# Altium schematic sheet GPIOs_Expander_Relay_Sheet.SchDoc
size 420 x 297 mm; SheetNumber: 5; SheetTotal: 12
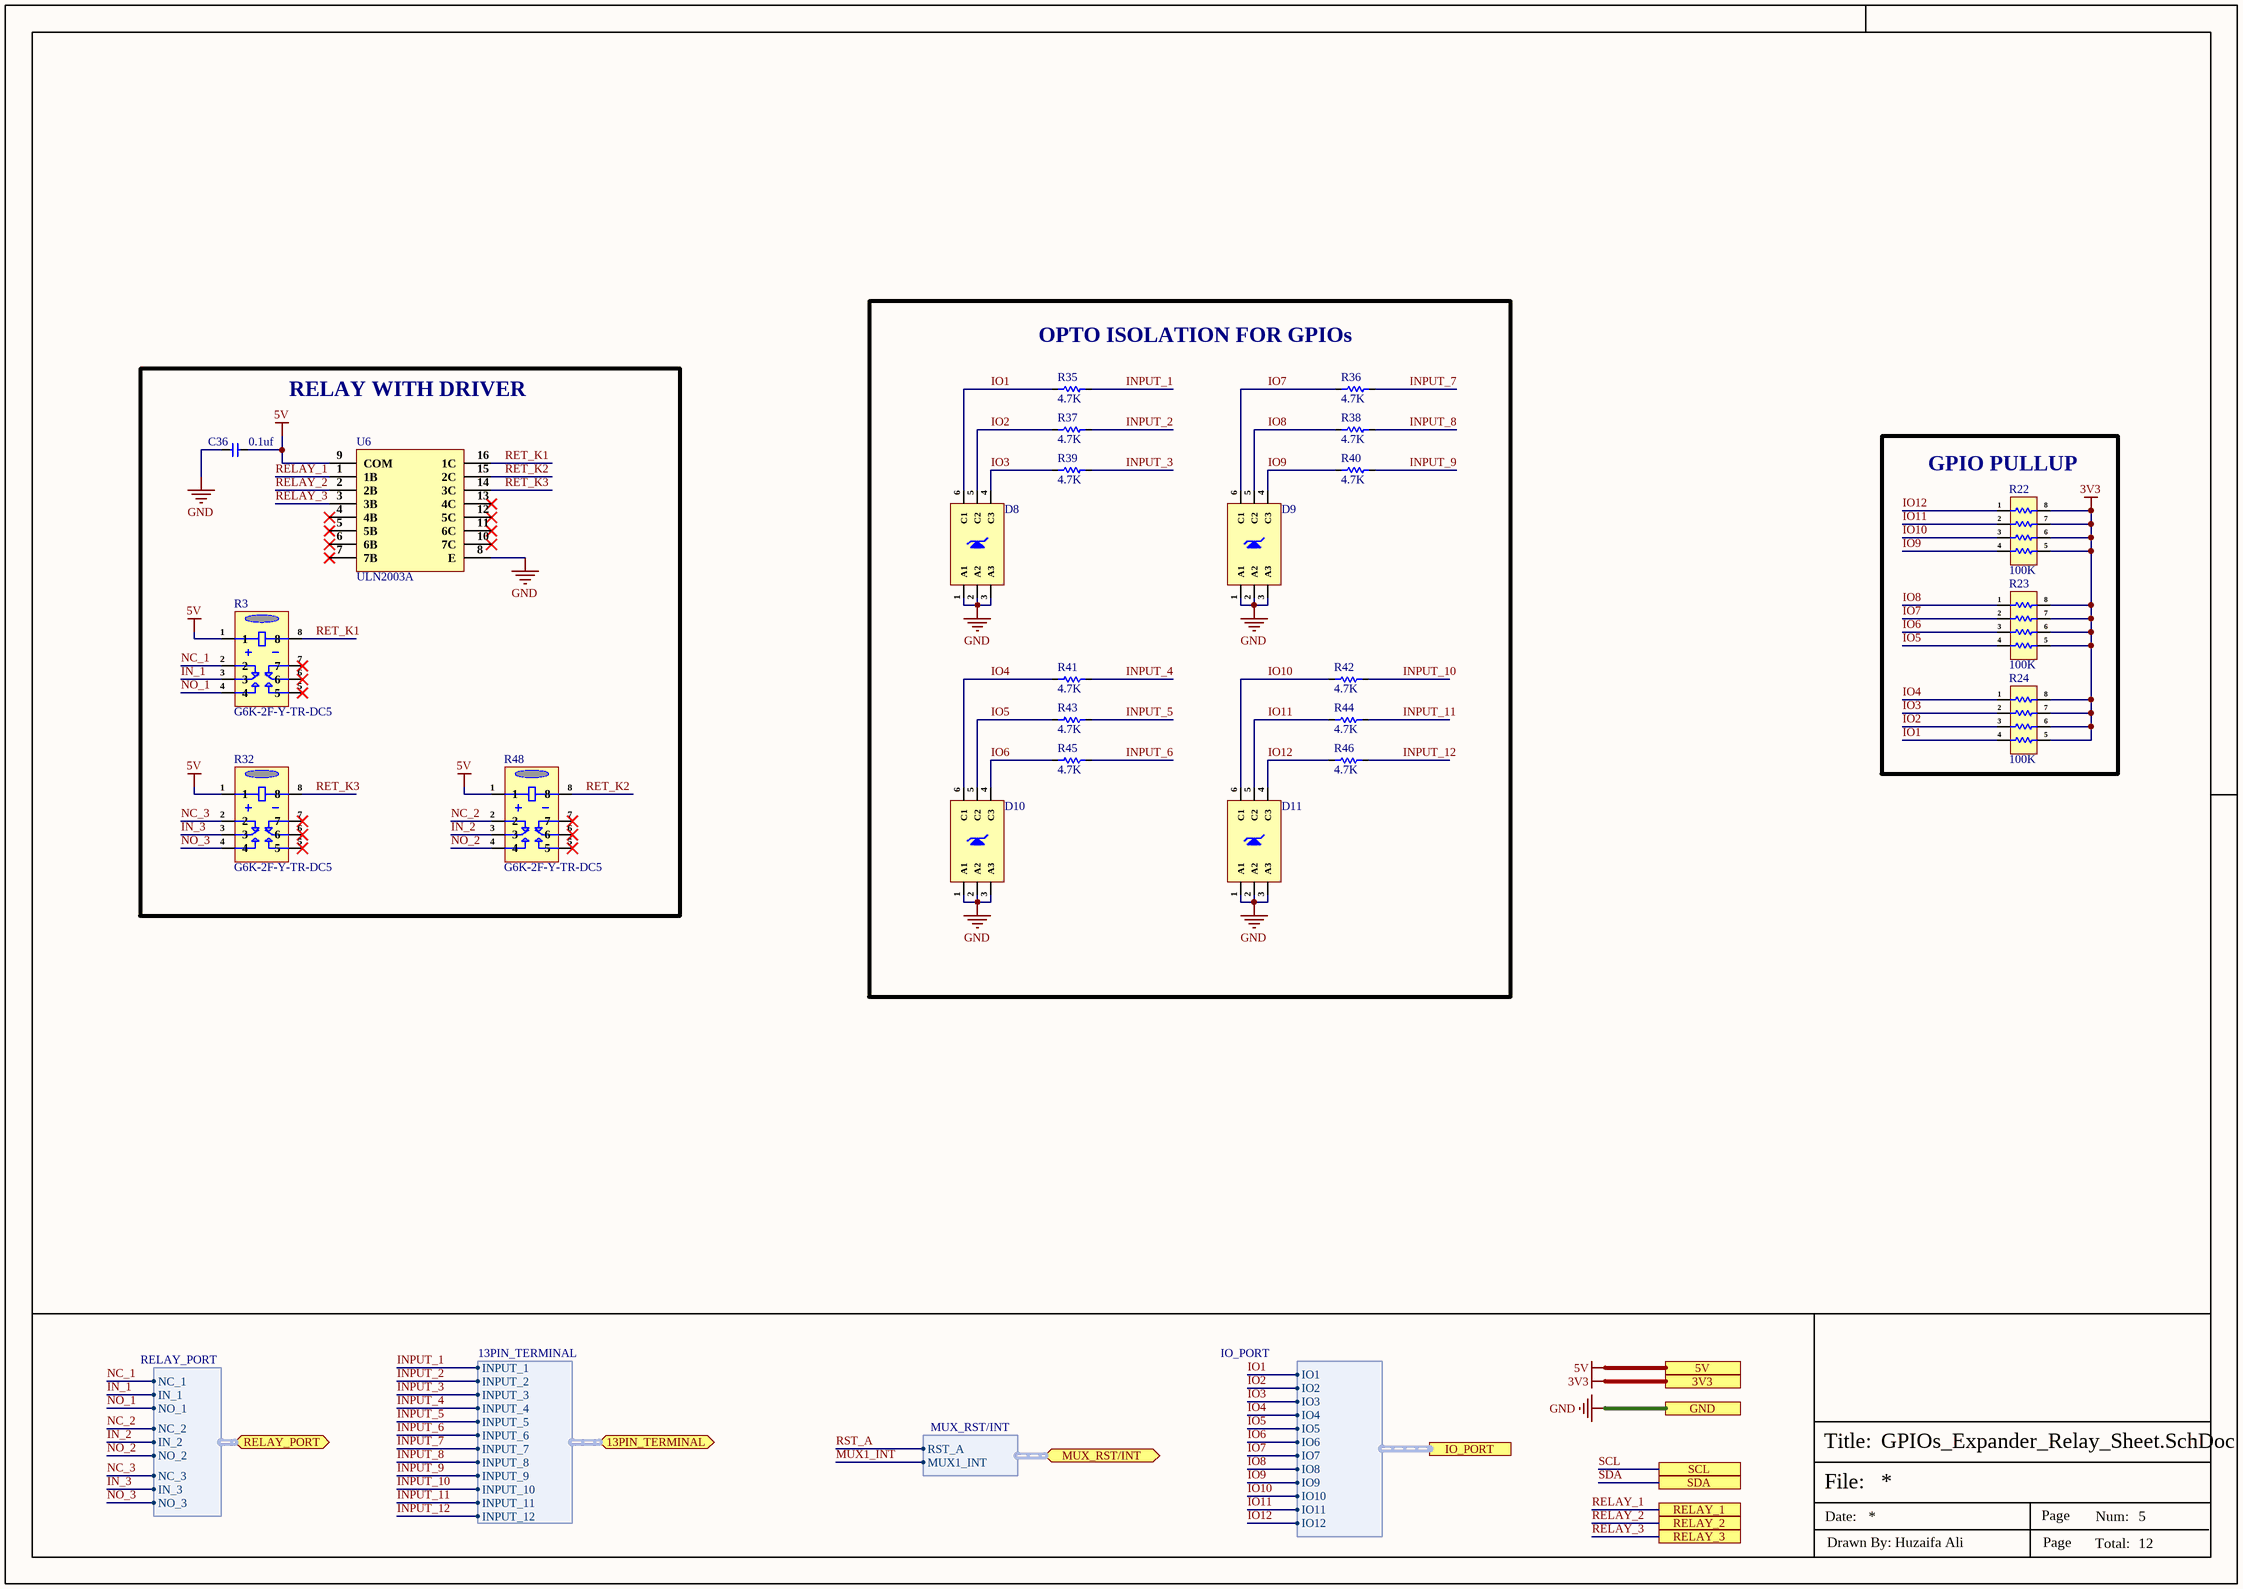
[diagram p0: GPIOs_Expander_Relay_Sheet.SchDoc]

## Parts
C36  0.1uf  [Cap-0402]
D8  BZX84C3V3TS-7-F  [SOT-363]  (value not drawn)
D9  BZX84C3V3TS-7-F  [SOT-363]  (value not drawn)
D10  BZX84C3V3TS-7-F  [SOT-363]  (value not drawn)
D11  BZX84C3V3TS-7-F  [SOT-363]  (value not drawn)
R3  G6K-2F-Y-TR-DC5  [G6K-2F-Y-TR DC5]
R22  100K  [YC164-JR-070RL]
R23  100K  [YC164-JR-070RL]
R24  100K  [YC164-JR-070RL]
R32  G6K-2F-Y-TR-DC5  [G6K-2F-Y-TR DC5]
R35  4.7K  [Res-0402]
R36  4.7K  [Res-0402]
R37  4.7K  [Res-0402]
R38  4.7K  [Res-0402]
R39  4.7K  [Res-0402]
R40  4.7K  [Res-0402]
R41  4.7K  [Res-0402]
R42  4.7K  [Res-0402]
R43  4.7K  [Res-0402]
R44  4.7K  [Res-0402]
R45  4.7K  [Res-0402]
R46  4.7K  [Res-0402]
R48  G6K-2F-Y-TR-DC5  [G6K-2F-Y-TR DC5]
U6  ULN2003A  [SOP-16_150mil]

## Blocks framed on the sheet
OPTO ISOLATION FOR GPIOs: D8-D11 R35-R46
RELAY WITH DRIVER: C36 R3 R32 R48 U6
GPIO PULLUP: R22-R24

## Ports
3V3, 5V, 13PIN_TERMINAL (bidir, harness 13PIN_TERMINAL), GND, IO_PORT (harness IO_PORT), MUX_RST/INT (bidir, harness MUX_RST/INT), RELAY_1, RELAY_2, RELAY_3, RELAY_PORT (bidir, harness RELAY_PORT), SCL, SDA

## Harnesses
RELAY_PORT: NC_1, NC_2, IN_1, IN_2, NO_1, NO_2, NC_3, IN_3, NO_3
13PIN_TERMINAL: INPUT_7, INPUT_1, INPUT_2, INPUT_8, INPUT_3, INPUT_9, INPUT_4, INPUT_10, INPUT_5, INPUT_11, INPUT_6, INPUT_12
MUX_RST/INT: RST_A, MUX1_INT
IO_PORT: IO1, IO2, IO3, IO4, IO5, IO6, IO7, IO9, IO10, IO11, IO12, IO8

## Nets
3V3: R22.5 R22.6 R22.7 R22.8 R23.5 R23.6 R23.7 R23.8 R24.5 R24.6 R24.7 R24.8 ; port 3V3
5V: C36.1 R3.1 R32.1 R48.1 U6.9(COM) ; port 5V
GND: C36.2 D8.1(A1) D8.2(A2) D8.3(A3) D9.1(A1) D9.2(A2) D9.3(A3) D10.1(A1) D10.2(A2) D10.3(A3) D11.1(A1) D11.2(A2) D11.3(A3) U6.8(E) ; port GND
IN_1: R3.3 ; port RELAY_PORT.IN_1
IN_2: R48.3 ; port RELAY_PORT.IN_2
IN_3: R32.3 ; port RELAY_PORT.IN_3
INPUT_1: R35.2 ; port 13PIN_TERMINAL.INPUT_1
INPUT_2: R37.2 ; port 13PIN_TERMINAL.INPUT_2
INPUT_3: R39.2 ; port 13PIN_TERMINAL.INPUT_3
INPUT_4: R41.2 ; port 13PIN_TERMINAL.INPUT_4
INPUT_5: R43.2 ; port 13PIN_TERMINAL.INPUT_5
INPUT_6: R45.2 ; port 13PIN_TERMINAL.INPUT_6
INPUT_7: R36.2 ; port 13PIN_TERMINAL.INPUT_7
INPUT_8: R38.2 ; port 13PIN_TERMINAL.INPUT_8
INPUT_9: R40.2 ; port 13PIN_TERMINAL.INPUT_9
INPUT_10: R42.2 ; port 13PIN_TERMINAL.INPUT_10
INPUT_11: R44.2 ; port 13PIN_TERMINAL.INPUT_11
INPUT_12: R46.2 ; port 13PIN_TERMINAL.INPUT_12
IO1: D8.6(C1) R24.4 R35.1 ; port IO_PORT.IO1
IO2: D8.5(C2) R24.3 R37.1 ; port IO_PORT.IO2
IO3: D8.4(C3) R24.2 R39.1 ; port IO_PORT.IO3
IO4: D10.6(C1) R24.1 R41.1 ; port IO_PORT.IO4
IO5: D10.5(C2) R23.4 R43.1 ; port IO_PORT.IO5
IO6: D10.4(C3) R23.3 R45.1 ; port IO_PORT.IO6
IO7: D9.6(C1) R23.2 R36.1 ; port IO_PORT.IO7
IO8: D9.5(C2) R23.1 R38.1 ; port IO_PORT.IO8
IO9: D9.4(C3) R22.4 R40.1 ; port IO_PORT.IO9
IO10: D11.6(C1) R22.3 R42.1 ; port IO_PORT.IO10
IO11: D11.5(C2) R22.2 R44.1 ; port IO_PORT.IO11
IO12: D11.4(C3) R22.1 R46.1 ; port IO_PORT.IO12
MUX1_INT: port MUX_RST/INT.MUX1_INT
NC_1: R3.2 ; port RELAY_PORT.NC_1
NC_2: R48.2 ; port RELAY_PORT.NC_2
NC_3: R32.2 ; port RELAY_PORT.NC_3
NO_1: R3.4 ; port RELAY_PORT.NO_1
NO_2: R48.4 ; port RELAY_PORT.NO_2
NO_3: R32.4 ; port RELAY_PORT.NO_3
RELAY_1: U6.1(1B) ; port RELAY_1
RELAY_2: U6.2(2B) ; port RELAY_2
RELAY_3: U6.3(3B) ; port RELAY_3
RET_K1: R3.8 U6.16(1C)
RET_K2: R48.8 U6.15(2C)
RET_K3: R32.8 U6.14(3C)
RST_A: port MUX_RST/INT.RST_A
SCL: port SCL
SDA: port SDA

Not connected (* = marked no-connect by the designer): R3 5* 6* 7*; R32 5* 6* 7*; R48 5* 6* 7*; U6 4(4B)* 5(5B)* 6(6B)* 7(7B)* 10(7C)* 11(6C)* 12(5C)* 13(4C)*

## Notes on the sheet
- File:
- Title:
- Date:
- Page
- Num:
- Total:
- Drawn By: Huzaifa Ali

## Library data of the parts
C36 = GRM155R62A104KE14D: CAP CER 0.1UF 100V X5R 0402; Manufacturer: Murata; Capacitance: 100nF; Tolerance: 10%; Item Type: Capacitor; Supplier 1: Arrow Electronics; Manufacturer Part Number: GRM155R62A104KE14D; RoHS: Yes; Category: Ceramic Capacitors; Stock 1: 870000; Pricing 1: 10000=0.00500, 20000=0.00410, 30000=0.00390, 50000=0.00370, 100000=0.00300 (USD); Mount: Surface Mount; Case/Package: 0402; Case Code (Metric): 1005; Case Code (Imperial): 0402; Weight: 0.000212oz; Min Operating Temperature: -55°C; Max Operating Temperature: 85°C; Packaging: Tape and Reel; Voltage Rating: 100V; Dielectric: X5R; Termination: SMD/SMT; Voltage Rating (DC): 100V; Package Quantity: 10000; Series: GRM; Length: 0.039inch; Width: 0.02inch; Height: 0.5mm; Thickness: 0.022inch; Reach SVHC Compliant: Yes; Lead Free: Lead Free; RoHS Compliant: Yes; ComponentLink1URL: http://www.farnell.com/datasheets/2079151.pdf?src-supplier=Farnell; ComponentLink1Description: http://www.farnell.com/datasheets/2079151.pdf?src-supplier=Farnell; ComponentLink2URL: http://www.mouser.com/ds/2/281/c02e-2905.pdf?src-supplier=Mouser; ComponentLink2Description: http://www.mouser.com/ds/2/281/c02e-2905.pdf?src-supplier=Mouser; ComponentLink3URL: http://www.farnell.com/datasheets/2079151.pdf?src-supplier=Element14; ComponentLink3Description: http://www.farnell.com/datasheets/2079151.pdf?src-supplier=Element14; ComponentLink4URL: http://search.murata.co.jp/Ceramy/image/img/A01X/G101/ENG/GRM155R62A104KE14-01.pdf?src-supplier=Digi-Key; ComponentLink4Description: http://search.murata.co.jp/Ceramy/image/img/A01X/G101/ENG/GRM155R62A104KE14-01.pdf?src-supplier=Digi-Key; ComponentLink5URL: http://www.farnell.com/datasheets/2079151.pdf?src-supplier=Newark; ComponentLink5Description: http://www.farnell.com/datasheets/2079151.pdf?src-supplier=Newark; Supplier Part Number 1: GRM155R62A104KE14D; LCSC Part Number: C162178
D8-D11 = BZX84C3V3TS-7-F: DIODE ZENER ARRAY 3.3V SOT363; Manufacturer: Diodes Incorporated; Manufacturer Part Number: BZX84C3V3TS-7-F; Package: SOT-363-6; LCSC Part Number: C5124989; Item Type: Diode; ComponentLink1Description: LCSC; ComponentLink1URL: https://www.lcsc.com/product-detail/Zener-Diodes_Diodes-Incorporated-BZX84C3V3TS-7-F_C5124989.html
R3 R32 R48 = G6K-2F-Y-TR-DC5: RELAY TELECOM DPDT 1A 5V; Manufacturer: Omron; Supplier: Digikey; Supplier Part Number: Z128CT-ND; Manufacturer Part Number: G6K-2F-Y-TR-DC5; RoHS: Yes; Category: Signal Relays; Stock: 17486; Pricing: 1=4.49, 10=4.211, 25=3.7428, 50=3.5558, 100=3.3686, 250=2.99428 (USD); ComponentLink1URL: https://datasheet.ciiva.com/2416/en-g6k-2416490.pdf?src-supplier=Digikey; ComponentLink1Description: https://datasheet.ciiva.com/2416/en-g6k-2416490.pdf?src-supplier=Digikey; ComponentLink2URL: https://datasheet.ciiva.com/30094/81en-g6k-30094551.pdf?src-supplier=Onlinecomponents.com; ComponentLink2Description: https://datasheet.ciiva.com/30094/81en-g6k-30094551.pdf?src-supplier=Onlinecomponents.com; LCSC Part Number: C47190; Item Type: Relay
R22-R24 = YC164-JR-07100KL: RES ARRAY 4 RES 100K OHM 1206; Manufacturer: Yageo; Item Type: Resistor; Supplier: Future Electronics; Supplier Part Number: 4734737; Manufacturer Part Number: YC164-JR-07100KL; RoHS: Yes; Category: Resistor Arrays; Stock: 10000; Pricing: 5000=0.0086, 20000=0.0082, 50000=0.0078, 100000=0.0078, 125000=0.0075, 200000=0.0076, 625000=0.0071 (USD); ComponentLink1URL: https://datasheet.ciiva.com/11807/0900766b80c69e1d-11807026.pdf?src-supplier=Rs; ComponentLink1Description: https://datasheet.ciiva.com/11807/0900766b80c69e1d-11807026.pdf?src-supplier=Rs; ComponentLink2URL: https://datasheet.ciiva.com/8017/443424-8017993.pdf?src-supplier=Element14; ComponentLink2Description: https://datasheet.ciiva.com/8017/443424-8017993.pdf?src-supplier=Element14; ComponentLink3URL: https://datasheet.ciiva.com/8017/443424-8017994.pdf?src-supplier=Element14; ComponentLink3Description: https://datasheet.ciiva.com/8017/443424-8017994.pdf?src-supplier=Element14; ComponentLink4URL: https://datasheet.ciiva.com/17478/pyu-yc-tc164-51-rohs-l-3-17478885.pdf?src-supplier=Future+Electronics; ComponentLink4Description: https://datasheet.ciiva.com/17478/pyu-yc-tc164-51-rohs-l-3-17478885.pdf?src-supplier=Future+Electronics; ComponentLink5URL: https://datasheet.ciiva.com/2693/pyu-yc-tc164-51-rohs-l-3-2693249.pdf?src-supplier=Digi-Key; ComponentLink5Description: https://datasheet.ciiva.com/2693/pyu-yc-tc164-51-rohs-l-3-2693249.pdf?src-supplier=Digi-Key; ComponentLink6URL: https://datasheet.ciiva.com/2693/pyu-yc-tc164-51-rohs-l-3-2693250.pdf?src-supplier=Digi-Key; ComponentLink6Description: https://datasheet.ciiva.com/2693/pyu-yc-tc164-51-rohs-l-3-2693250.pdf?src-supplier=Digi-Key; ComponentLink7URL: https://datasheet.ciiva.com/2693/pyu-yc-tc164-51-rohs-l-3-2693251.pdf?src-supplier=Digi-Key; ComponentLink7Description: https://datasheet.ciiva.com/2693/pyu-yc-tc164-51-rohs-l-3-2693251.pdf?src-supplier=Digi-Key; LCSC Part Number: C192933
R35-R46 = RC0402FR-074K7L: RES 4.7K OHM 1% 1/16W 0402; Manufacturer: Yageo; Voltage Rating (DC): 50V; Power Rating: 62.5mW; Resistance: 4.7kR; Temperature Coefficient: 100ppm/°C; Max Power Dissipation: 63mW; Item Type: Resistor; Supplier 1: Avnet; Manufacturer Part Number: RC0402FR-074K7L; RoHS: Yes; Category: Chip SMD Resistors; Stock 1: 2420000; Pricing 1: 10000=0.00085 (USD); Case/Package: 0402; Number of Pins: 2; Case Code (Imperial): 0402; Case Code (Metric): 1005; Size Code: 0402; Min Operating Temperature: -55°C; Max Operating Temperature: 155°C; Tolerance: 1%; Voltage Rating: 50V; Packaging: Tape and Reel; Resistor Type: Thick Film; Termination: SMD/SMT; Features: Moisture Resistant; Series: RC; Number of Terminations: 2; Resistance Tolerance: 1%; Construction: Rectangular; Length: 1mm; Width: 0.5mm; Height: 0.32mm; Depth: 0.5mm; Height - Seated (Max): 0.016inch; RoHS Compliant: Yes; Reach SVHC Compliant: Yes; Military Standard: Not; Lead Free: Lead Free; ComponentLink1URL: https://datasheet.ciiva.com/22661/1686128-22661342.pdf?src-supplier=Element14; ComponentLink1Description: https://datasheet.ciiva.com/22661/1686128-22661342.pdf?src-supplier=Element14; ComponentLink2URL: https://datasheet.ciiva.com/7850/1018594-7850022.pdf?src-supplier=Element14; ComponentLink2Description: https://datasheet.ciiva.com/7850/1018594-7850022.pdf?src-supplier=Element14; ComponentLink3URL: https://datasheet.ciiva.com/7850/1018594-7850023.pdf?src-supplier=Element14; ComponentLink3Description: https://datasheet.ciiva.com/7850/1018594-7850023.pdf?src-supplier=Element14; ComponentLink4URL: https://datasheet.ciiva.com/15215/getdatasheetpartid-328119-15215035.pdf?src-supplier=Verical; ComponentLink4Description: https://datasheet.ciiva.com/15215/getdatasheetpartid-328119-15215035.pdf?src-supplier=Verical; Supplier Part Number 1: RC0402FR-074K7L; LCSC Part Number: C105871
U6 = ULN2003A: 100uA@50V 3V@2V,300mA 1.6V@350mA 4mA@12V 100uA@50V 1.25V@350mA 500mA 25pF SOP-16_150mil Darlington Transistor Arrays ROHS; Manufacturer: Mixic; Item Type: IC; Manufacturer Part Number: ULN2003A; Package: SOP-16_150mil; LCSC Part Number: C181730; ComponentLink1Description: LCSC; ComponentLink1URL: https://www.lcsc.com/product-detail/Darlington-Transistor-Arrays_Mixic-ULN2003A_C181730.html